# Altium schematic sheet Power_Connector.SchDoc
size A; SheetNumber: 2; SheetTotal: 7
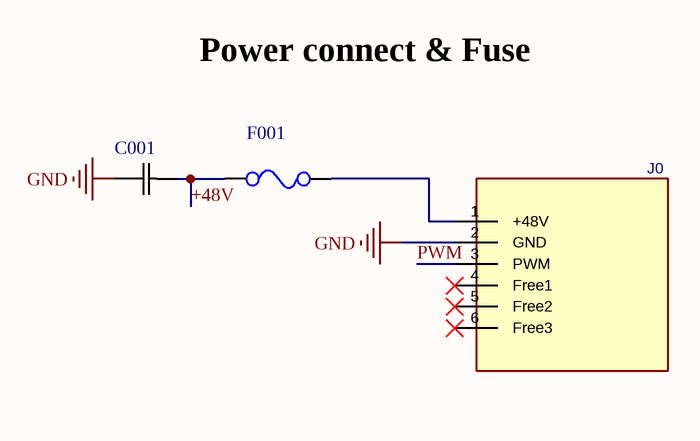
[diagram p0: Power_Connector.SchDoc]

## Parts
C001  MAL214658471E3  [CAP_2135_18X20_VIS]  (value not drawn)
F001  JFC2410-2200FS  [F_2410_JDTfuse]  (value not drawn)
J0  AS150UPB_2+4  [AS150UPB_2+4]  (value not drawn)

## Nets
GND: C001.2 J0.2(GND)
+48V: C001.1 F001.2
PWM: J0.3(PWM)
NetF001_1: F001.1 J0.1(+48V)

Not connected (* = marked no-connect by the designer): J0 4(Free1)* 5(Free2)* 6(Free3)*

## Notes on the sheet
- Power connect & Fuse

## Library data of the parts
C001 = MAL214658471E3: Rad 63V 470uF 18x20 125Â°C (CA); Manufacturer_Name: Vishay; Copyright: Copyright (C) 2026 Ultra Librarian. All rights reserved.; Manufacturer_Part_Number: MAL214658471E3; JLCPCB Part #: C85979
F001 = JFC2410-2200FS: 20A Fuse. 72V; LSCS Part #: JDTfuse